# Altium schematic sheet Step_Drive.SchDoc
size A; SheetNumber: 1; SheetTotal: 2
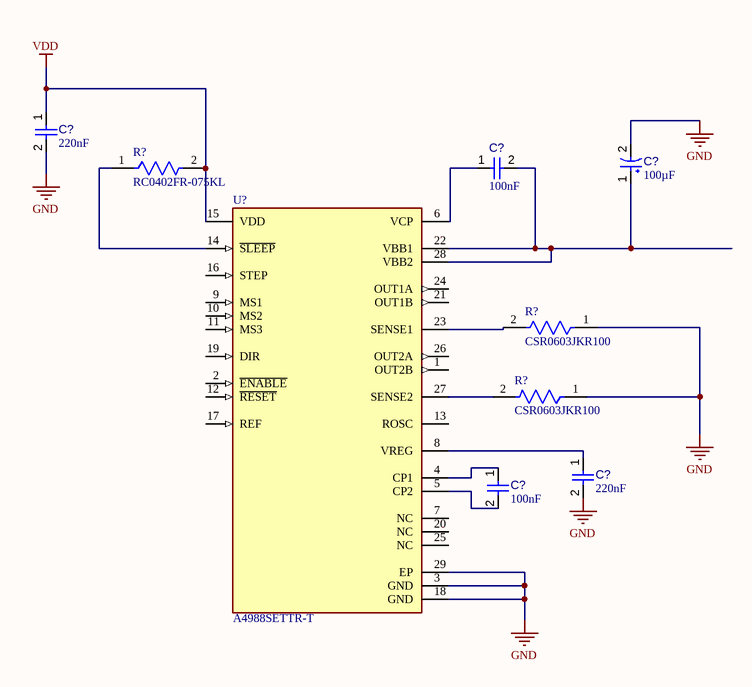
[diagram p0: Step_Drive.SchDoc]

## Parts
(Parts that share a designator on the sheet are numbered #1, #2 ... from top to bottom, then left to right.)
C?#1  value 220nF  [CAPC0402(1005)60_L]  (hidden comment: Capacitor 220nF +/-20% 10V 0402)
C?#2  value 100nF  [CAPC1608X90X40NL10T20]  (hidden comment: Capacitor 100 nF +/-10% 50 V 0603)
C?#3  value 100µF  [CAPPR65-500-1600X1000X1700]  (hidden comment: ECA-2AM101)
C?#4  value 220nF  [CAPC0402(1005)60_L]  (hidden comment: Capacitor 220nF +/-20% 10V 0402)
C?#5  value 100nF  [CAPC1608X90X40NL10T20]  (hidden comment: Capacitor 100 nF +/-10% 50 V 0603)
R?#1  RC0402FR-075KL  [FP-RC0402-MFG]
R?#2  CSR0603JKR100  [FP-CSR0603-IPC_B]
R?#3  CSR0603JKR100  [FP-CSR0603-IPC_B]
U?  A4988SETTR-T  [FP-ET-28-MFG]

## Nets
GND: C?#1.2 C?#3.2 C?#4.2 R?#2.1 R?#3.1 U?.3(GND) U?.18(GND) U?.29(EP)
VDD: C?#1.1 R?#1.2 U?.15(VDD)
NetC?#2_1: C?#2.1 U?.6(VCP)
NetC?#2_2: C?#2.2 C?#3.1 U?.22(VBB1) U?.28(VBB2)
NetC?#4_1: C?#4.1 U?.8(VREG)
NetC?#5_1: C?#5.1 U?.4(CP1)
NetC?#5_2: C?#5.2 U?.5(CP2)
NetR?#1_1: R?#1.1 U?.14(~{SLEEP})
NetR?#2_2: R?#2.2 U?.23(SENSE1)
NetR?#3_2: R?#3.2 U?.27(SENSE2)

Not connected (* = marked no-connect by the designer): U? 1(OUT2B) 2(~{ENABLE}) 7(NC) 9(MS1) 10(MS2) 11(MS3) 12(~{RESET}) 13(ROSC) 16(STEP) 17(REF) 19(DIR) 20(NC) 21(OUT1B) 24(OUT1A) 25(NC) 26(OUT2A)

## Library data of the parts
C?#1 C?#4 = CMP-001-00057-3: Chip Capacitor, 220nF +/-20%, 10V, 0402, Thickness 0.6 mm; Tolerance: 10%; Max Operating Temperature: 85°C; Pins: 2; Case/Package: 0402; Mounting Technology: SMT; Voltage Rating: 10V; Min Operating Temperature: -55°C
C?#2 C?#5 = CMP-001-00017-6: Chip Capacitor, 100 nF, +/- 10%, 50 V, 0603 (1608 Metric); Voltage Rating: 50V; Capacitor Type: Ceramic; Tolerance: 10%; Mounting Technology: SM; Max Operating Temperature: 125°C; RoHS Compliant: True; Pins: 2; Case/Package: 0603; Min Operating Temperature: -55°C
C?#3 = CMP-001-00034-7: Aluminum Electrolytic Capacitor, 100 uF, +/- 20%, 100 V, -40 to 85 degC, 2-Pin THD, RoHS, Bulk; Manufacturer: Panasonic; Ripple Current (AC): 350mA; Voltage Rating: 100V; Max Operating Temperature: 85°C; Package Quantity: 200; Package Description: 2-Pin Through Hole Device, Dia 10 mm, Body Length 16 mm; Package Reference: CAPPR65-500-1600X1000X1700; Pins: 2; Case/Package: Radial; Datasheet URL: https://industrial.panasonic.com/cdbs/www-data/pdf/RDF0000/ABA0000C1047.pdf; Manufacturer URL: http://www.panasonic.com/; Mounting Technology: TH; Packaging: Bulk; Min Operating Temperature: -40°C; Capacitor Type: Electrolytic; Datasheet Version: Mar-16; RoHS Compliant: True; Tolerance: 20%; Diameter: 10mm; Ripple Current: 350mA; Lead Pitch: 5mm
R?#1 = CMP-03412-013078-1: RES SMD 5K OHM 1% 1/16W 0402; Manufacturer: Yageo; Resistance: 5kΩ; Temperature Coefficient: 100ppm/°C; Power Rating: 0.0625W; Voltage Rating: 50V; Value: 5kΩ; Temperature Range Low: -55°C; Lead Free: Yes; RoHS: TRUE; Device Class L2: Resistors; Package: RC0402; Footprint Url: https://pccomponents.com/datasheets/YAGEO-20RESISTORS.PDF; Height: 0.4mm; ComponentLink2URL: http://www.yageo.com/documents/recent/PYu-RC_Group_51_RoHS_L_10.pdf; Temperature: -55°C to +155°C; Composition: Thick Film; Device Class L1: Passive Components; Series: RC_L; Ipc Land Pattern Name: RESC10050X35; Tolerance: 1%; Device Class L3: Chip SMD Resistors; Temperature Range High: +155°C; Category: Res; Automotive: No; Octopart: https://octopart.com/rc0402fr-075kl-yageo-25450038; Digikey Description: RES SMD 5K OHM 1% 1/16W 0402; ComponentLink2Description: Datasheet; Manufacturer Part Number: RC0402FR-075KL
R?#2 R?#3 = CMP-26527-003046-1: General Purpose Thick Film Chip Resistor, 0603, 0.1Ω, 5%, 300ppm/°C, 0.125W; Resistance: 100mR; Resistor Type: Thick Film; Min Operating Temperature: -55°C; Temperature Coefficient: 300ppm/°C; Max Operating Temperature: 155°C; RoHS Compliant: Yes; Packaging: Tape and Reel; Mount: Surface Mount; Contact Plating: Tin; Case/Package: 0603; Radiation Hardening: No; Tolerance: 5%
U? = CMP-1742-00003-2: IC MTR DRVR BIPOLAR 3-5.5V 28QFN; Number of Outputs: 1; Motor Type: Stepper; Output Current: 2A; Min Supply Voltage: 8V; Output Voltage: 35V; Package Quantity: 1; Max Operating Temperature: 85°C; Case/Package: QFN EP; Mount: Surface Mount; Packaging: Tape and Reel; Radiation Hardening: No; REACH SVHC: No SVHC; Min Operating Temperature: -20°C; Max Supply Voltage: 35V; Number of Pins: 28